# Altium schematic sheet TC-RK3568-Sheet.SchDoc
size 420 x 297 mm; SheetNumber: 12; SheetTotal: 12
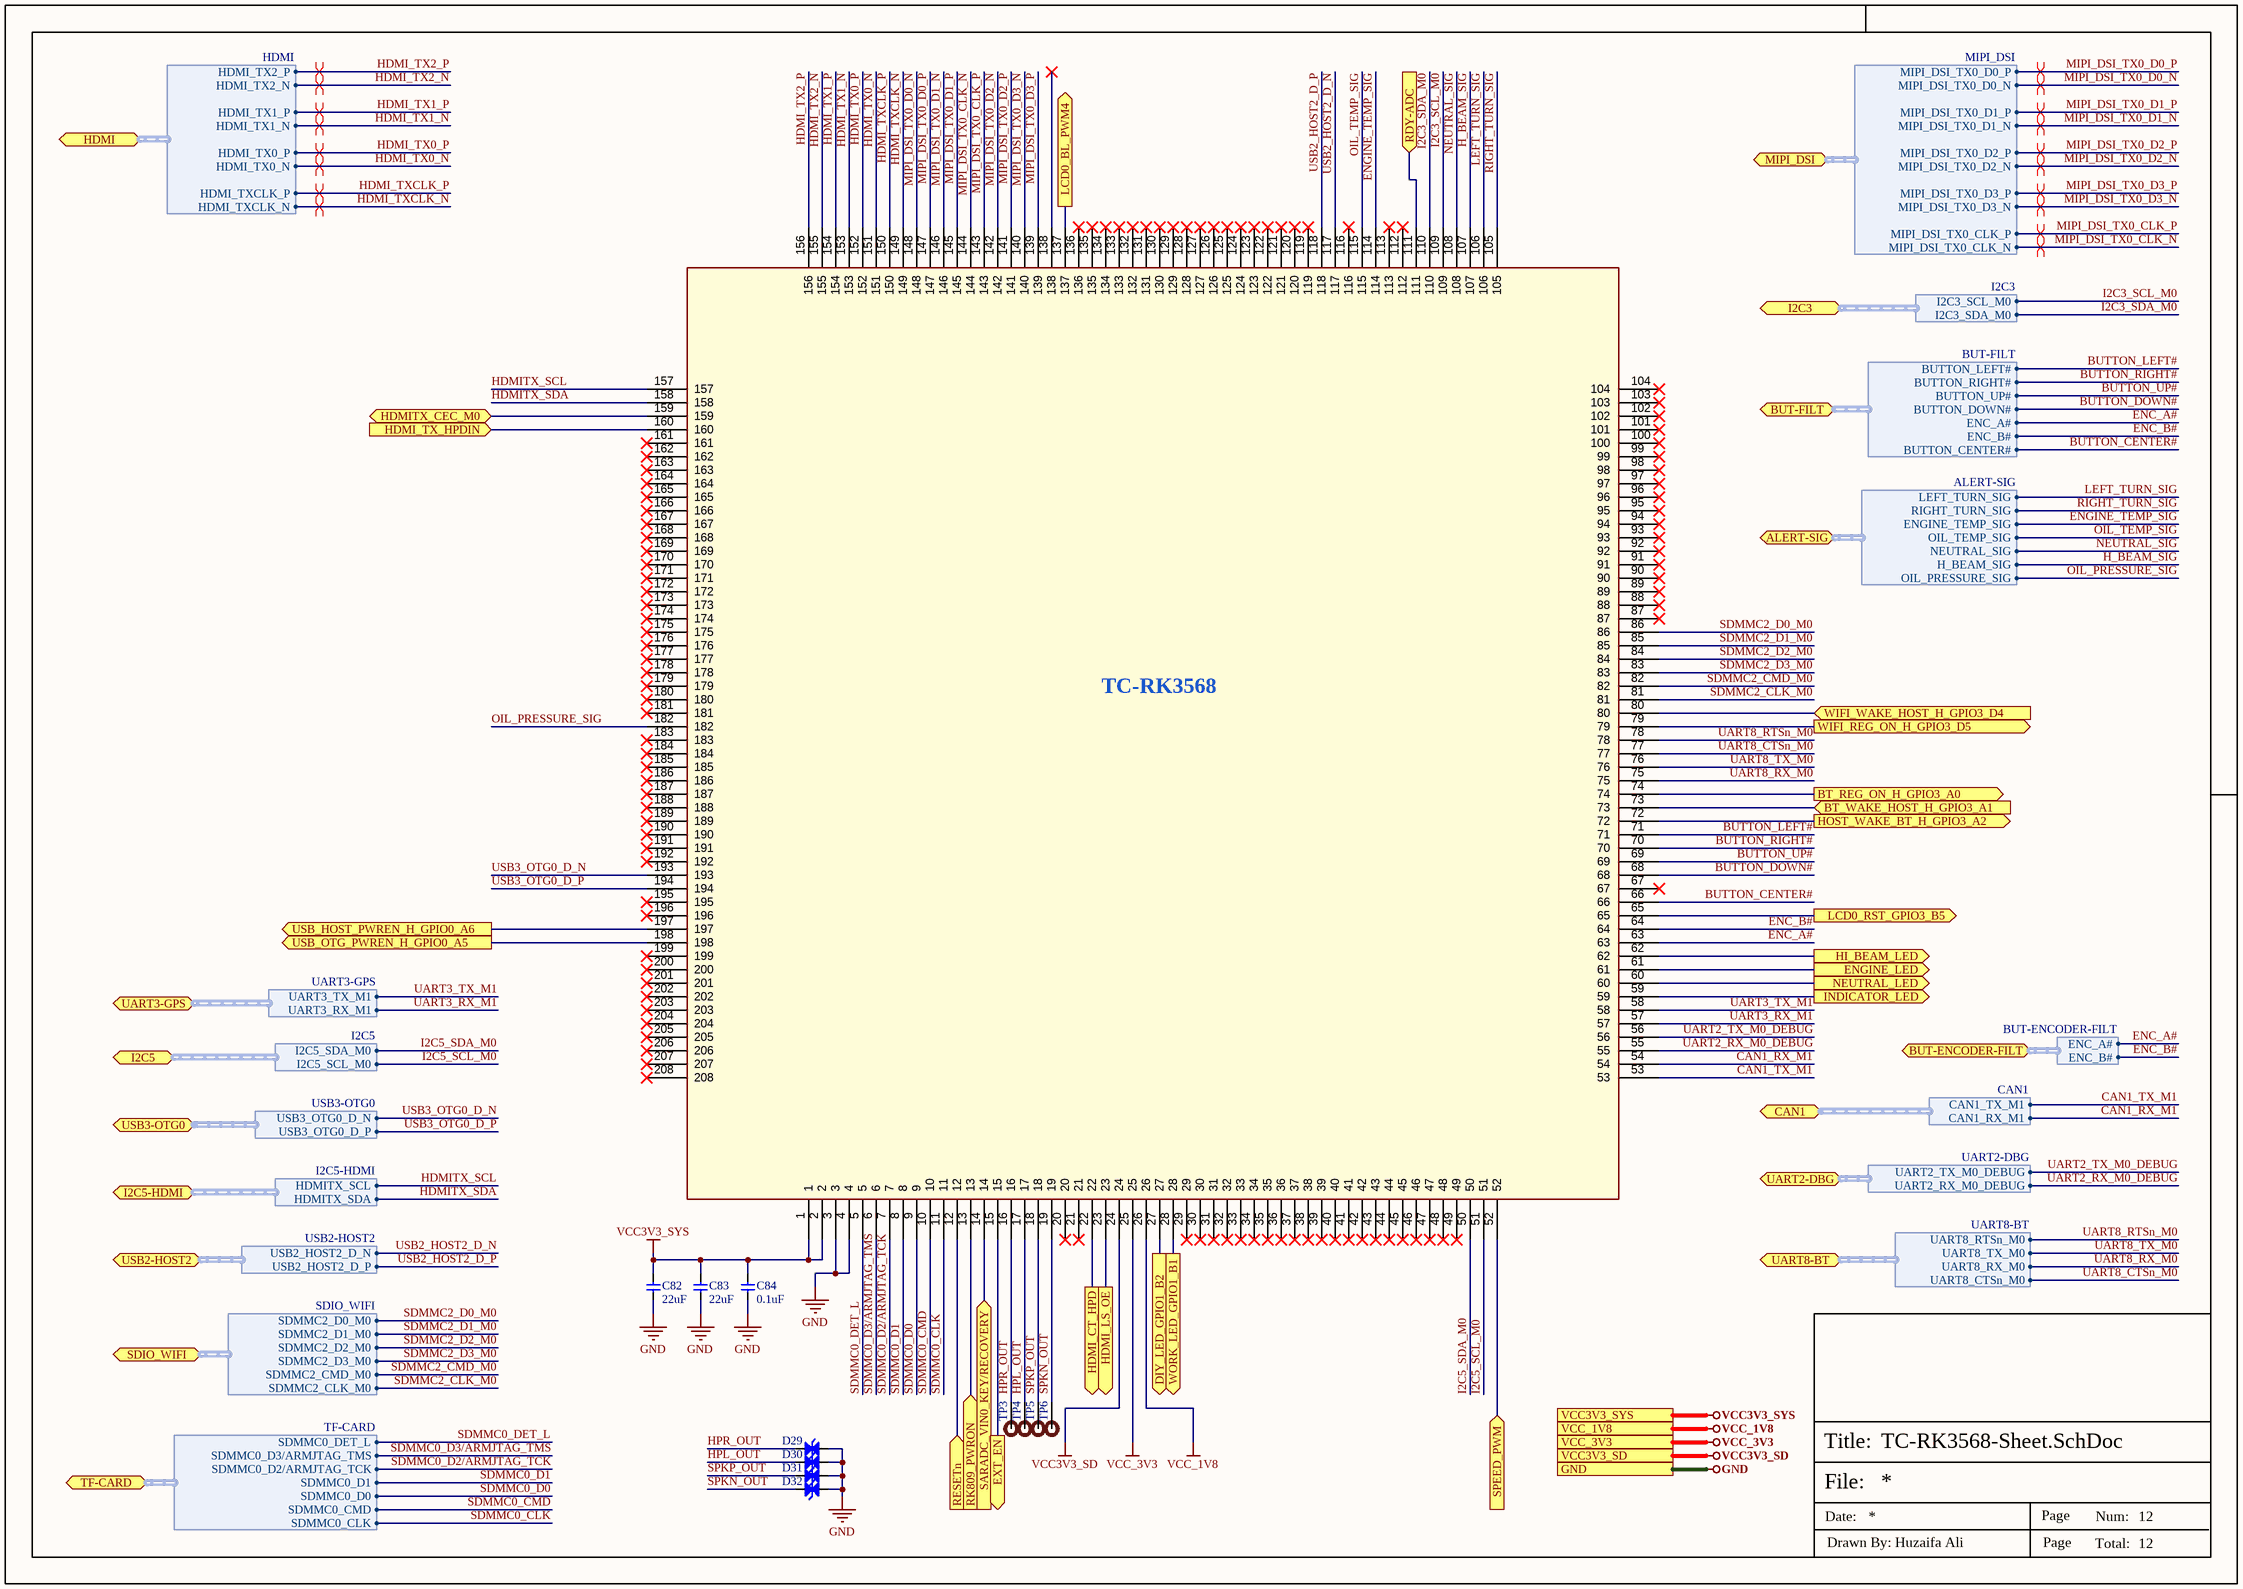
[diagram p0: TC-RK3568-Sheet.SchDoc]

## Parts
C82  22uF  [Cap-0603]
C83  22uF  [Cap-0603]
C84  0.1uF  [Cap-0402]
D29  ESD5451N  [DFN1006-2L (Bi-Directional)]  (value not drawn)
D30  ESD5451N  [DFN1006-2L (Bi-Directional)]  (value not drawn)
D31  ESD5451N  [DFN1006-2L (Bi-Directional)]  (value not drawn)
D32  ESD5451N  [DFN1006-2L (Bi-Directional)]  (value not drawn)
M1  TC-RK3568  [CON_208P_X3568-MB]  (value not drawn)
TP3  TEST POINT 0.5mm Dia  [Test-point - 0.5mm]  (value not drawn)  (no BOM)
TP4  TEST POINT 0.5mm Dia  [Test-point - 0.5mm]  (value not drawn)  (no BOM)
TP5  TEST POINT 0.5mm Dia  [Test-point - 0.5mm]  (value not drawn)  (no BOM)
TP6  TEST POINT 0.5mm Dia  [Test-point - 0.5mm]  (value not drawn)  (no BOM)

## Ports
ALERT-SIG (bidir, harness ALERT-SIG, see Top-Sheet[4B], Peripherals-Sheet-2[4D]), BT_REG_ON_H_GPIO3_A0 (out, see Top-Sheet[3B], WiFi-Sheet[1A]), BT_WAKE_HOST_H_GPIO3_A1 (in, see Top-Sheet[3A], WiFi-Sheet[1B]), BUT-ENCODER-FILT (bidir, harness BUT-ENCODER-FILT, see Top-Sheet[4B], Peripherals-Sheet-2[3D]), BUT-FILT (bidir, harness BUT-FILT, see Top-Sheet[4B], Peripherals-Sheet-2[3D]), CAN1 (bidir, harness CAN1, see Top-Sheet[3C], CAN-Debug-Sheet[1D]), DIY_LED_GPIO1_B2 (out, see Top-Sheet[3C], CAN-Debug-Sheet[3C]), ENGINE_LED (out, see Top-Sheet[4B], Peripherals-Sheet-2[5C]), EXT_EN (out, see Top-Sheet[3A], Power-Sheet[1C]), GND (see Top-Sheet[3A], CAN-Debug-Sheet[5D], Connector-Sheet[5D], HDMI-Sheet[5D], MIPI-Display-Sheet[5D], Peripherals-Sheet-1[5D], Peripherals-Sheet-2[5D], Power-Sheet[5D], TF-Card-Sheet[4D], USB-Sheet[5D], WiFi-Sheet[4D]), HDMI (bidir, harness HDMI, see Top-Sheet[4B], HDMI-Sheet[1D]), HDMI_CT_HPD (out, see Top-Sheet[4A], HDMI-Sheet[2B]), HDMI_LS_OE (out, see Top-Sheet[4A], HDMI-Sheet[2B]), HDMI_TX_HPDIN (in, see Top-Sheet[4A], HDMI-Sheet[2B]), HDMITX_CEC_M0 (bidir, see Top-Sheet[4A], HDMI-Sheet[2B]), HI_BEAM_LED (out, see Top-Sheet[4B], Peripherals-Sheet-2[5C]), HOST_WAKE_BT_H_GPIO3_A2 (out, see Top-Sheet[3B], WiFi-Sheet[1B]), I2C3 (bidir, harness I2C3, see Top-Sheet[4C], Peripherals-Sheet-1[2D]), I2C5 (bidir, harness I2C5, see Top-Sheet[3A], Power-Sheet[1D]), I2C5-HDMI (bidir, harness I2C5-HDMI, see Top-Sheet[4B], HDMI-Sheet[2D]), INDICATOR_LED (out, see Top-Sheet[4B], Peripherals-Sheet-2[4C]), LCD0_BL_PWM4 (out, see Top-Sheet[3B], MIPI-Display-Sheet[1B]), LCD0_RST_GPIO3_B5 (out, see Top-Sheet[3B], MIPI-Display-Sheet[4B]), MIPI_DSI (bidir, harness MIPI_DSI, see Top-Sheet[3C], MIPI-Display-Sheet[1D]), NEUTRAL_LED (out, see Top-Sheet[4B], Peripherals-Sheet-2[4C]), RDY-ADC (in, see Top-Sheet[4B], Peripherals-Sheet-1[6A]), RESETn (in, see Top-Sheet[3C], CAN-Debug-Sheet[1B]), RK809_PWRON (in, see Top-Sheet[3C], CAN-Debug-Sheet[5B]), SARADC_VIN0_KEY/RECOVERY (in, see Top-Sheet[3C], CAN-Debug-Sheet[2B]), SDIO_WIFI (bidir, harness SDIO_WIFI, see Top-Sheet[3B], WiFi-Sheet[3D]), SPEED_PWM (in, see Top-Sheet[4B], Peripherals-Sheet-1[3C]), TF-CARD (bidir, harness TF-CARD, see Top-Sheet[4A], TF-Card-Sheet[1D]), UART2-DBG (bidir, harness UART2-DBG, see Top-Sheet[3C], CAN-Debug-Sheet[2D]), UART3-GPS (bidir, harness UART3-GPS, see Top-Sheet[4C], Peripherals-Sheet-1[1D]), UART8-BT (bidir, harness UART8-BT, see Top-Sheet[3B], WiFi-Sheet[1D]), USB2-HOST2 (bidir, harness USB2-HOST2, see Top-Sheet[3B], USB-Sheet[1D]), USB3-OTG0 (bidir, harness USB3-OTG0, see Top-Sheet[3B], USB-Sheet[3D]), USB_HOST_PWREN_H_GPIO0_A6 (out, see Top-Sheet[3B], USB-Sheet[1B]), USB_OTG_PWREN_H_GPIO0_A5 (out, see Top-Sheet[3B], USB-Sheet[1C]), VCC3V3_SD (see Top-Sheet[3A], TF-Card-Sheet[4D]), VCC3V3_SYS (see Top-Sheet[3A], Peripherals-Sheet-1[5D], Peripherals-Sheet-2[5D], Power-Sheet[5D], WiFi-Sheet[4D]), VCC_1V8 (see Top-Sheet[3A], Peripherals-Sheet-1[5D], WiFi-Sheet[4D]), VCC_3V3 (see Top-Sheet[3A], CAN-Debug-Sheet[5D], HDMI-Sheet[5D], MIPI-Display-Sheet[5D], WiFi-Sheet[4D]), WIFI_REG_ON_H_GPIO3_D5 (out, see Top-Sheet[3B], WiFi-Sheet[3B]), WIFI_WAKE_HOST_H_GPIO3_D4 (in, see Top-Sheet[3A], WiFi-Sheet[3B]), WORK_LED_GPIO1_B1 (out, see Top-Sheet[3C], CAN-Debug-Sheet[1C])

## Harnesses
TF-CARD: SDMMC0_CMD, SDMMC0_CLK, SDMMC0_D0, SDMMC0_DET_L, SDMMC0_D3/ARMJTAG_TMS, SDMMC0_D2/ARMJTAG_TCK, SDMMC0_D1
I2C5: I2C5_SDA_M0, I2C5_SCL_M0
CAN1: CAN1_TX_M1, CAN1_RX_M1
UART2-DBG: UART2_TX_M0_DEBUG, UART2_RX_M0_DEBUG
UART3-GPS: UART3_TX_M1, UART3_RX_M1
UART8-BT: UART8_RTSn_M0, UART8_TX_M0, UART8_RX_M0, UART8_CTSn_M0
SDIO_WIFI: SDMMC2_D0_M0, SDMMC2_D1_M0, SDMMC2_D2_M0, SDMMC2_D3_M0, SDMMC2_CMD_M0, SDMMC2_CLK_M0
USB2-HOST2: USB2_HOST2_D_N, USB2_HOST2_D_P
MIPI_DSI: MIPI_DSI_TX0_D0_P, MIPI_DSI_TX0_D0_N, MIPI_DSI_TX0_D1_P, MIPI_DSI_TX0_D1_N, MIPI_DSI_TX0_D2_P, MIPI_DSI_TX0_D2_N, MIPI_DSI_TX0_D3_P, MIPI_DSI_TX0_D3_N, MIPI_DSI_TX0_CLK_P, MIPI_DSI_TX0_CLK_N
HDMI: HDMI_TX2_P, HDMI_TX2_N, HDMI_TX1_P, HDMI_TX1_N, HDMI_TX0_P, HDMI_TX0_N, HDMI_TXCLK_P, HDMI_TXCLK_N
I2C5-HDMI: HDMITX_SCL, HDMITX_SDA
USB3-OTG0: USB3_OTG0_D_N, USB3_OTG0_D_P
I2C3: I2C3_SCL_M0, I2C3_SDA_M0
BUT-FILT: BUTTON_LEFT#, BUTTON_RIGHT#, BUTTON_UP#, BUTTON_DOWN#, ENC_A#, ENC_B#, BUTTON_CENTER#
ALERT-SIG: LEFT_TURN_SIG, RIGHT_TURN_SIG, ENGINE_TEMP_SIG, OIL_TEMP_SIG, NEUTRAL_SIG, H_BEAM_SIG, OIL_PRESSURE_SIG
BUT-ENCODER-FILT: ENC_A#, ENC_B#

## Nets
GND: C82.1 C83.1 C84.1 D29.1(K) D30.1(K) D31.1(K) D32.1(K) M1.3 M1.4 ; port GND
VCC3V3_SD: M1.24 ; port VCC3V3_SD
VCC3V3_SYS: C82.2 C83.2 C84.2 M1.1 M1.2 ; port VCC3V3_SYS
VCC_1V8: M1.26 ; port VCC_1V8
VCC_3V3: M1.25 ; port VCC_3V3
BT_REG_ON_H_GPIO3_A0: M1.74 ; port BT_REG_ON_H_GPIO3_A0
BT_WAKE_HOST_H_GPIO3_A1: M1.73 ; port BT_WAKE_HOST_H_GPIO3_A1
BUTTON_CENTER#: M1.66 ; port BUT-FILT.BUTTON_CENTER#
BUTTON_DOWN#: M1.68 ; port BUT-FILT.BUTTON_DOWN#
BUTTON_LEFT#: M1.71 ; port BUT-FILT.BUTTON_LEFT#
BUTTON_RIGHT#: M1.70 ; port BUT-FILT.BUTTON_RIGHT#
BUTTON_UP#: M1.69 ; port BUT-FILT.BUTTON_UP#
CAN1_RX_M1: M1.54 ; port CAN1.CAN1_RX_M1
CAN1_TX_M1: M1.53 ; port CAN1.CAN1_TX_M1
DIY_LED_GPIO1_B2: M1.27 ; port DIY_LED_GPIO1_B2
ENC_A#: M1.63 ; port BUT-FILT.ENC_A#, port BUT-ENCODER-FILT.ENC_A#
ENC_B#: M1.64 ; port BUT-FILT.ENC_B#, port BUT-ENCODER-FILT.ENC_B#
ENGINE_LED: M1.61 ; port ENGINE_LED
ENGINE_TEMP_SIG: M1.114 ; port ALERT-SIG.ENGINE_TEMP_SIG
EXT_EN: M1.15 ; port EXT_EN
H_BEAM_SIG: M1.107 ; port ALERT-SIG.H_BEAM_SIG
HDMI_CT_HPD: M1.22 ; port HDMI_CT_HPD
HDMI_LS_OE: M1.23 ; port HDMI_LS_OE
HDMI_TX0_N: M1.151 ; port HDMI.HDMI_TX0_N
HDMI_TX0_P: M1.152 ; port HDMI.HDMI_TX0_P
HDMI_TX1_N: M1.153 ; port HDMI.HDMI_TX1_N
HDMI_TX1_P: M1.154 ; port HDMI.HDMI_TX1_P
HDMI_TX2_N: M1.155 ; port HDMI.HDMI_TX2_N
HDMI_TX2_P: M1.156 ; port HDMI.HDMI_TX2_P
HDMI_TX_HPDIN: M1.160 ; port HDMI_TX_HPDIN
HDMI_TXCLK_N: M1.149 ; port HDMI.HDMI_TXCLK_N
HDMI_TXCLK_P: M1.150 ; port HDMI.HDMI_TXCLK_P
HDMITX_CEC_M0: M1.159 ; port HDMITX_CEC_M0
HDMITX_SCL: M1.157 ; port I2C5-HDMI.HDMITX_SCL
HDMITX_SDA: M1.158 ; port I2C5-HDMI.HDMITX_SDA
HI_BEAM_LED: M1.62 ; port HI_BEAM_LED
HOST_WAKE_BT_H_GPIO3_A2: M1.72 ; port HOST_WAKE_BT_H_GPIO3_A2
HPL_OUT: D30.2(K) M1.17 TP4.1
HPR_OUT: D29.2(K) M1.16 TP3.1
I2C3_SCL_M0: M1.109 ; port I2C3.I2C3_SCL_M0
I2C3_SDA_M0: M1.110 ; port I2C3.I2C3_SDA_M0
I2C5_SCL_M0: M1.51 ; port I2C5.I2C5_SCL_M0
I2C5_SDA_M0: M1.50 ; port I2C5.I2C5_SDA_M0
INDICATOR_LED: M1.59 ; port INDICATOR_LED
LCD0_BL_PWM4: M1.137 ; port LCD0_BL_PWM4
LCD0_RST_GPIO3_B5: M1.65 ; port LCD0_RST_GPIO3_B5
LEFT_TURN_SIG: M1.106 ; port ALERT-SIG.LEFT_TURN_SIG
MIPI_DSI_TX0_CLK_N: M1.144 ; port MIPI_DSI.MIPI_DSI_TX0_CLK_N
MIPI_DSI_TX0_CLK_P: M1.143 ; port MIPI_DSI.MIPI_DSI_TX0_CLK_P
MIPI_DSI_TX0_D0_N: M1.148 ; port MIPI_DSI.MIPI_DSI_TX0_D0_N
MIPI_DSI_TX0_D0_P: M1.147 ; port MIPI_DSI.MIPI_DSI_TX0_D0_P
MIPI_DSI_TX0_D1_N: M1.146 ; port MIPI_DSI.MIPI_DSI_TX0_D1_N
MIPI_DSI_TX0_D1_P: M1.145 ; port MIPI_DSI.MIPI_DSI_TX0_D1_P
MIPI_DSI_TX0_D2_N: M1.142 ; port MIPI_DSI.MIPI_DSI_TX0_D2_N
MIPI_DSI_TX0_D2_P: M1.141 ; port MIPI_DSI.MIPI_DSI_TX0_D2_P
MIPI_DSI_TX0_D3_N: M1.140 ; port MIPI_DSI.MIPI_DSI_TX0_D3_N
MIPI_DSI_TX0_D3_P: M1.139 ; port MIPI_DSI.MIPI_DSI_TX0_D3_P
NEUTRAL_LED: M1.60 ; port NEUTRAL_LED
NEUTRAL_SIG: M1.108 ; port ALERT-SIG.NEUTRAL_SIG
OIL_PRESSURE_SIG: M1.182 ; port ALERT-SIG.OIL_PRESSURE_SIG
OIL_TEMP_SIG: M1.115 ; port ALERT-SIG.OIL_TEMP_SIG
RDY-ADC: M1.111 ; port RDY-ADC
RESETn: M1.12 ; port RESETn
RIGHT_TURN_SIG: M1.105 ; port ALERT-SIG.RIGHT_TURN_SIG
RK809_PWRON: M1.13 ; port RK809_PWRON
SARADC_VIN0_KEY/RECOVERY: M1.14 ; port SARADC_VIN0_KEY/RECOVERY
SDMMC0_CLK: M1.11 ; port TF-CARD.SDMMC0_CLK
SDMMC0_CMD: M1.10 ; port TF-CARD.SDMMC0_CMD
SDMMC0_D0: M1.9 ; port TF-CARD.SDMMC0_D0
SDMMC0_D1: M1.8 ; port TF-CARD.SDMMC0_D1
SDMMC0_D2/ARMJTAG_TCK: M1.7 ; port TF-CARD.SDMMC0_D2/ARMJTAG_TCK
SDMMC0_D3/ARMJTAG_TMS: M1.6 ; port TF-CARD.SDMMC0_D3/ARMJTAG_TMS
SDMMC0_DET_L: M1.5 ; port TF-CARD.SDMMC0_DET_L
SDMMC2_CLK_M0: M1.81 ; port SDIO_WIFI.SDMMC2_CLK_M0
SDMMC2_CMD_M0: M1.82 ; port SDIO_WIFI.SDMMC2_CMD_M0
SDMMC2_D0_M0: M1.86 ; port SDIO_WIFI.SDMMC2_D0_M0
SDMMC2_D1_M0: M1.85 ; port SDIO_WIFI.SDMMC2_D1_M0
SDMMC2_D2_M0: M1.84 ; port SDIO_WIFI.SDMMC2_D2_M0
SDMMC2_D3_M0: M1.83 ; port SDIO_WIFI.SDMMC2_D3_M0
SPEED_PWM: M1.52 ; port SPEED_PWM
SPKN_OUT: D32.2(K) M1.19 TP6.1
SPKP_OUT: D31.2(K) M1.18 TP5.1
UART2_RX_M0_DEBUG: M1.55 ; port UART2-DBG.UART2_RX_M0_DEBUG
UART2_TX_M0_DEBUG: M1.56 ; port UART2-DBG.UART2_TX_M0_DEBUG
UART3_RX_M1: M1.57 ; port UART3-GPS.UART3_RX_M1
UART3_TX_M1: M1.58 ; port UART3-GPS.UART3_TX_M1
UART8_CTSn_M0: M1.77 ; port UART8-BT.UART8_CTSn_M0
UART8_RTSn_M0: M1.78 ; port UART8-BT.UART8_RTSn_M0
UART8_RX_M0: M1.75 ; port UART8-BT.UART8_RX_M0
UART8_TX_M0: M1.76 ; port UART8-BT.UART8_TX_M0
USB2_HOST2_D_N: M1.117 ; port USB2-HOST2.USB2_HOST2_D_N
USB2_HOST2_D_P: M1.118 ; port USB2-HOST2.USB2_HOST2_D_P
USB3_OTG0_D_N: M1.193 ; port USB3-OTG0.USB3_OTG0_D_N
USB3_OTG0_D_P: M1.194 ; port USB3-OTG0.USB3_OTG0_D_P
USB_HOST_PWREN_H_GPIO0_A6: M1.197 ; port USB_HOST_PWREN_H_GPIO0_A6
USB_OTG_PWREN_H_GPIO0_A5: M1.198 ; port USB_OTG_PWREN_H_GPIO0_A5
WIFI_REG_ON_H_GPIO3_D5: M1.79 ; port WIFI_REG_ON_H_GPIO3_D5
WIFI_WAKE_HOST_H_GPIO3_D4: M1.80 ; port WIFI_WAKE_HOST_H_GPIO3_D4
WORK_LED_GPIO1_B1: M1.28 ; port WORK_LED_GPIO1_B1

Not connected (* = marked no-connect by the designer): M1 20* 21* 29* 30* 31* 32* 33* 34* 35* 36* 37* 38* 39* 40* 41* 42* 43* 44* 45* 46* 47* 48* 49* 67* 87* 88* 89* 90* 91* 92* 93* 94* 95* 96* 97* 98* 99* 100* 101* 102* 103* 104* 112* 113* 116* 119* 120* 121* 122* 123* 124* 125* 126* 127* 128* 129* 130* 131* 132* 133* 134* 135* 136* 138* 161* 162* 163* 164* 165* 166* 167* 168* 169* 170* 171* 172* 173* 174* 175* 176* 177* 178* 179* 180* 181* 183* 184* 185* 186* 187* 188* 189* 190* 191* 192* 195* 196* 199* 200* 201* 202* 203* 204* 205* 206* 207* 208*

## Layout directives
differential pair; differential pair class MIPI; rule Impedance Constraint [Min = 97.00    Max = 103.0    ]: MIPI_DSI_TX0_CLK_N, MIPI_DSI_TX0_CLK_P, MIPI_DSI_TX0_D0_N, MIPI_DSI_TX0_D0_P, MIPI_DSI_TX0_D1_N, MIPI_DSI_TX0_D1_P, MIPI_DSI_TX0_D2_N, MIPI_DSI_TX0_D2_P, MIPI_DSI_TX0_D3_N, MIPI_DSI_TX0_D3_P
differential pair; differential pair class HDMI100: HDMI_TX0_N, HDMI_TX0_P, HDMI_TX1_N, HDMI_TX1_P, HDMI_TX2_N, HDMI_TX2_P, HDMI_TXCLK_N, HDMI_TXCLK_P

## Notes on the sheet
- File:
- Title:
- Date:
- Page
- Num:
- Total:
- Drawn By: Huzaifa Ali

## Library data of the parts
C82 C83 = CC0603MRX5R6BB226: CAP CER 22UF 10V X5R 0603; Manufacturer: Yageo; Tolerance: 20%; Item Type: Capacitor; Supplier 1: Digi-Key; Manufacturer Part Number: CC0603MRX5R6BB226; RoHS: Yes; Category: Ceramic Capacitors; Stock 1: 19628; Pricing 1: 1=0.68000, 10=0.48000, 50=0.36300, 100=0.31610, 500=0.23416, 1000=0.19903 (USD); Mount: Surface Mount; Case/Package: 0603; Case Code (Metric): 1608; Case Code (Imperial): 0603; Weight: 7.1E-05oz; Min Operating Temperature: -55°C; Max Operating Temperature: 85°C; Packaging: Tape and Reel; Capacitance: 22uF; Voltage Rating: 10V; Dielectric: X5R; Termination: SMD/SMT; Voltage Rating (DC): 10V; Package Quantity: 4000; Length: 0.063inch; Width: 0.8mm; Height: 0.8mm; Thickness: 0.035inch; Lead Free: Lead Free; Halogen Free: Halogen Free; RoHS Compliant: Yes; ComponentLink1URL: http://www.mouser.com/ds/2/447/Yageo_UPY-GP_NP0_16V-to-50V_9-358835.pdf?src-supplier=Mouser; ComponentLink1Description: http://www.mouser.com/ds/2/447/Yageo_UPY-GP_NP0_16V-to-50V_9-358835.pdf?src-supplier=Mouser; ComponentLink2URL: http://www.yageo.com/documents/recent/UPY-GPHC_X5R_4V-to-50V_25.pdf?src-supplier=Digi-Key; ComponentLink2Description: http://www.yageo.com/documents/recent/UPY-GPHC_X5R_4V-to-50V_25.pdf?src-supplier=Digi-Key; Supplier Part Number 1: 311-1819-1-ND; LCSC Part Number: C109447
C84 = GRM155R71H104ME14D: CAP CER 0.1UF 50V X7R 0402; Manufacturer: Murata; Tolerance: 20%; Capacitance: 100nF; Item Type: Capacitor; Supplier 1: Avnet; Manufacturer Part Number: GRM155R71H104ME14D; RoHS: Yes; Category: Ceramic Capacitors; Stock 1: 100000; Pricing 1: 10000=0.00444, 20000=0.00420, 40000=0.00396, 60000=0.00372, 80000=0.00348, 100000=0.00324, 1000000=0.00300 (USD); Mount: Surface Mount; Case/Package: 0402; Min Operating Temperature: -55°C; Max Operating Temperature: 125°C; Packaging: Cut Tape; Voltage Rating: 50V; Length: 0.039inch; Width: 0.02inch; Thickness: 0.022inch; RoHS Compliant: Yes; ComponentLink1URL: http://www.mouser.com/ds/2/281/c02e-2905.pdf?src-supplier=Mouser; ComponentLink1Description: http://www.mouser.com/ds/2/281/c02e-2905.pdf?src-supplier=Mouser; ComponentLink2URL: http://search.murata.co.jp/Ceramy/image/img/A01X/G101/ENG/GRM155R71H104ME14-01.pdf?src-supplier=Digi-Key; ComponentLink2Description: http://search.murata.co.jp/Ceramy/image/img/A01X/G101/ENG/GRM155R71H104ME14-01.pdf?src-supplier=Digi-Key; ComponentLink3URL: http://psearch.en.murata.com/capacitor/product/GRM155R71H104ME14%23.pdf?src-supplier=Avnet; ComponentLink3Description: http://psearch.en.murata.com/capacitor/product/GRM155R71H104ME14%23.pdf?src-supplier=Avnet; Supplier Part Number 1: GRM155R71H104ME14D; LCSC Part Number: C182412
D29-D32 = ESD5451N: DFN1006-2(0402) ESD Protection Devices ROHS; Manufacturer: TECH PUBLIC; Manufacturer Part Number: ESD5451N; Footprint: DFN1006-2(0402); ComponentLink1Description: LCSC; ComponentLink1URL: https://www.lcsc.com/product-detail/span-style-background-color-ff0-ESD-span-Protection-Devices_TECH-PUBLIC-ESD5451N_C2936977.html; LCSC Part Number: C2936977
TP3-TP6 = TEST POINT 0.5mm Dia: Test Point ON; Item Type: Test Point; Manufacturer Part Number: TEST POINT 0.5mm Dia